# Altium schematic sheet MIDI.SchDoc
size A4; SheetNumber: 6; SheetTotal: 12
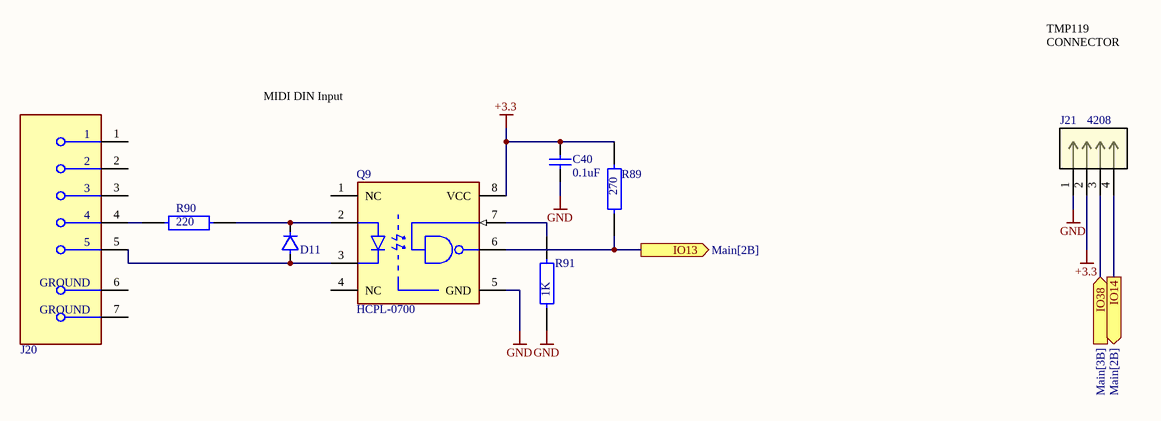
[diagram p0: MIDI.SchDoc]

## Parts
C40  0.1uF  [0805-hs]
D11  1N4148WS  [4148]  (value not drawn)
J20  PJ366ST  [THONK_PJ366ST_MIDI_TRS]  (value not drawn)
J21  4208  [CONN_CCSH-W10R-04TR-BK-A_ADA]
Q9  HCPL-0700  [D8_N]
R89  270  [0805-hs]
R90  220  [0805-hs]
R91  1K  [0805-hs]

## Ports
IO13 (out, see Main[2B]), IO14 (out, see Main[2B]), IO38 (in, see Main[3B])

## Nets
+3.3: C40.2 J21.2 Q9.8(VCC) R89.2
GND: C40.1 J21.1 Q9.5(GND) R91.1
IO13: Q9.6(VO) R89.1 ; port IO13
IO14: J21.4 ; port IO14
IO38: J21.3 ; port IO38
NetD11_1: D11.1(C) Q9.2(A) R90.2
NetD11_2: D11.2(A) J20.5 Q9.3(C)
NetJ20_4: J20.4 R90.1
NetQ9_7: Q9.7(VE) R91.2

Not connected (* = marked no-connect by the designer): J20 1 2 3 6(GROUND) 7(GROUND); Q9 1(NC) 4(NC)

## Notes on the sheet
- TMP119 CONNECTOR
- MIDI DIN Input

## Library data of the parts
C40 = CAP-np: Manufacturer: Vitramon; Part Number: VJ0805Y682KXAMT
D11 = 4148WS: DIODE GEN PURP 75V 150MA SOD323F; Forward Voltage: 1V; Power Dissipation: 200mW; Element Configuration: Single; Max Forward Surge Current (Ifsm): 2A; Peak Reverse Current: 5uA; Recovery Time: 4ns; Package Quantity: 1; Number of Pins: 2; Height: 1mm; REACH SVHC: No SVHC; Max Reverse Voltage (DC): 75V; Forward Current: 150mA; Length: 1.8mm; Max Repetitive Reverse Voltage (Vrrm): 75V; Max Operating Temperature: 150°C; Average Rectified Current: 150mA; Contact Plating: Tin; Packaging: Tape and Reel; Radiation Hardening: No; Min Operating Temperature: -55°C; Width: 1.35mm; Weight: 0.0276g; Lead Free: Lead Free; Mount: Surface Mount; Reverse Voltage: 75V; Reverse Recovery Time: 4ns
J20 = MIDI_connector: 3.5mm TRS jack (stereo Thonkiconn PJ366ST), MIDI TRS Type A: tip=5, ring=4, sleeve=2; Number of Contacts: 5; Gender: Female; Current Rating: 3A; Voltage Rating: 34V; Strain Relief: No (Without); Number of Ports: 1; Connector Type: Receptacle; Body Material: Metal; RoHS Compliant: Yes; Radiation Hardening: No; Package Quantity: 1; Case/Package: Metal; Insulation Material: Plastic; Number of Terminals/Pins: 5; Packaging: Bulk; Contact Type: Pin; Series: -; Mount: Through Hole; Contact Plating: Nickel; Termination: Solder; Number of Positions: 5; Orientation: Right Angle; Lead Free: Lead Free; Color: Black; Fastening Type: Pull
J21 = 4208: Description; Manufacturer_Name: Adafruit Industries; Copyright: Copyright (C) 2025 Ultra Librarian. All rights reserved.; Manufacturer_Part_Number: 4208; RefDes: RefDes; Type: Type
Q9 = 6n137: Optocoupler, Darlington output (6N138 type), SO-8; Manufacturer: Broadcom; Manufacturer Part Number: HCPL-0700-000E; Min Supply Voltage: 4.5V; Forward Voltage: 1.5V; Turn Off Delay Time: 50ns; Standoff Height: 0.505mm; Reverse Voltage: 5V; Isolation Voltage: 3750Vrms; Forward Current: 10mA; Turn On Delay Time: 48ns; Max Supply Voltage: 5.5V; Package: 0; Automotive: No; Lead Free: Yes; ComponentLink2Description: Datasheet; Temperature: -40°C to +85°C; Device Class L3: unset; Height: 4.455mm; Ambient Temperature Range Low: -40°C; Digikey Description: OPTOISO 3.75KV OPN COLL 8DIP GW; Temperature Range Low: -40°C; ComponentLink2URL: https://docs.broadcom.com/docs/AV02-0940EN; Mouser Description: High Speed Optocouplers 10 Mb/s 3750Vrms; Category: Trans; Ambient Temperature Range High: +85°C; RoHS: TRUE; Octopart: https://octopart.com/search?q=HCPL-0700-000E; Device Class L1: Optoelectronics; Device Class L2: Optocouplers; Temperature Range High: +85°C
R89-R91 = Resistor: RES 10K OHM 0.1% 1/8W 0805